# Altium schematic sheet 02.C208. A01-A22. Module BASU Optics Horizontal motor .SchDoc: Кабель двигателя ГН оптики
size 209 x 297 mm; Author: Мурашкин Д.В.; Address1: Address1; Address2: Address2; Address3: Address3; Address4: Address4; DocumentNumber: ИЗДЕЛИЕ-1-2; SheetNumber: 20; Scale: 1:1; Letter1Column: Э
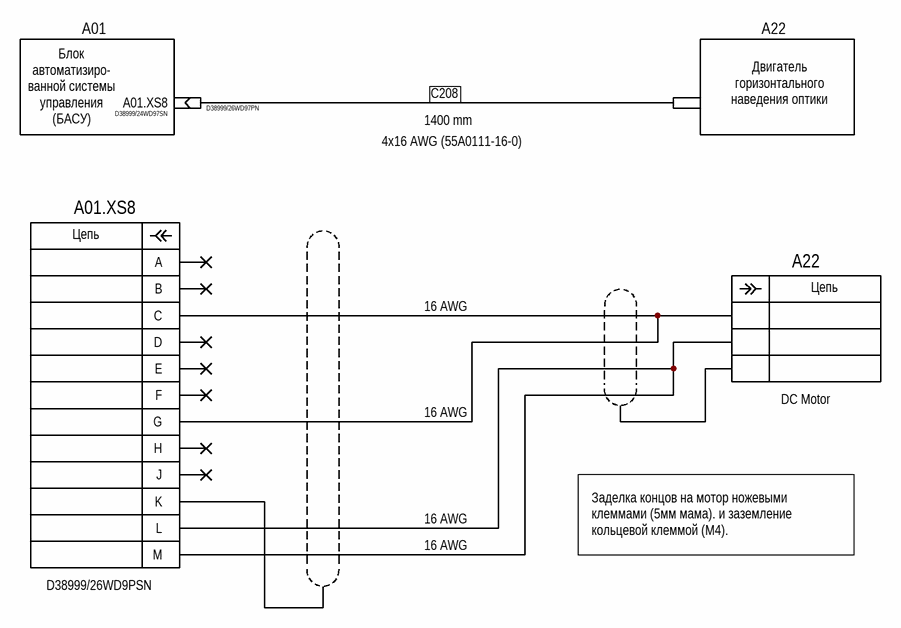
[diagram p0: 02.C208. A01-A22. Module BASU Optics Horizontal motor .SchDoc]

## Parts
(Parts that share a designator on the sheet are numbered #1, #2 ... from top to bottom, then left to right.)
A01.XS8#1  D38999/24WD97SN
A01.XS8#2  D38999/26WD9PSN
A22  DC Motor
A?#1  D38999/26WD97PN
A?#2  Провод  (value not drawn)  (no BOM)

## Nets
С208: A?#1.0 A?#2.0
NetA01.XS8#2_C: A01.XS8#2.C A01.XS8#2.G A22.?2
NetA01.XS8#2_L: A01.XS8#2.L A01.XS8#2.M A22.?1

Not connected (* = marked no-connect by the designer): A01.XS8#1 0; A01.XS8#2 A* B* D* E* F* H* J* K; A22 ?3

## Notes on the sheet
- A01
- A22
- (near A?#2) Двигатель горизонтального наведения оптики
- Блок автоматизиро- ванной системы управления (БАСУ)
- 4x16 AWG (55A0111-16-0)
- 1400 mm
- 16 AWG
- Заделка концов на мотор ножевыми клеммами (5мм мама). и заземление кольцевой клеммой (М4).
- Перв. примен.
- Справ. №
- Подп. и дата
- Инв. № дубл.
- Взам. инв. №
- Инв. № подл.
- Изм.
- Лист
- № докум.
- Подп.
- Дата
- 2.106-A4
- Копировал
- Формат А4
- (in symbol Connector signal P5_1_1_1) Цепь
- (in symbol Connector signal P12 MIL) Цепь

## Library data of the parts
A01.XS8#1 = Connector cable socket: Part name: D38999/24WD97SN; Operating temperature: -°C +°C; Mounting type: Surface mount; Dimension: .0mm x .0mm; Height: .0mm
A01.XS8#2 = Connector signal P12 MIL: P12 MIL; Operating temperature: -°C +°C; Mounting type: Surface mount; Dimension: .0mm x .0mm; Height: .0mm
A22 = Connector signal P5_1_1_1: Part name: DC Motor; Operating temperature: -°C +°C; Mounting type: Surface mount; Dimension: .0mm x .0mm; Height: .0mm
A?#1 = Connector cable plug: Part name: D38999/26WD97PN; Operating temperature: -°C +°C; Mounting type: Surface mount; Dimension: .0mm x .0mm; Height: .0mm
A?#2 = Connector cable coupling: Operating temperature: -°C +°C; Mounting type: Surface mount; Dimension: .0mm x .0mm; Height: .0mm